# Altium schematic sheet 202_DC-DC.SchDoc: DC-DC
size A4; Date: XXXXXX; Author: R.Ducuara; DrawnBy: J.Jaramillo; Revision: R1V0; SheetNumber: 5; SheetTotal: 7
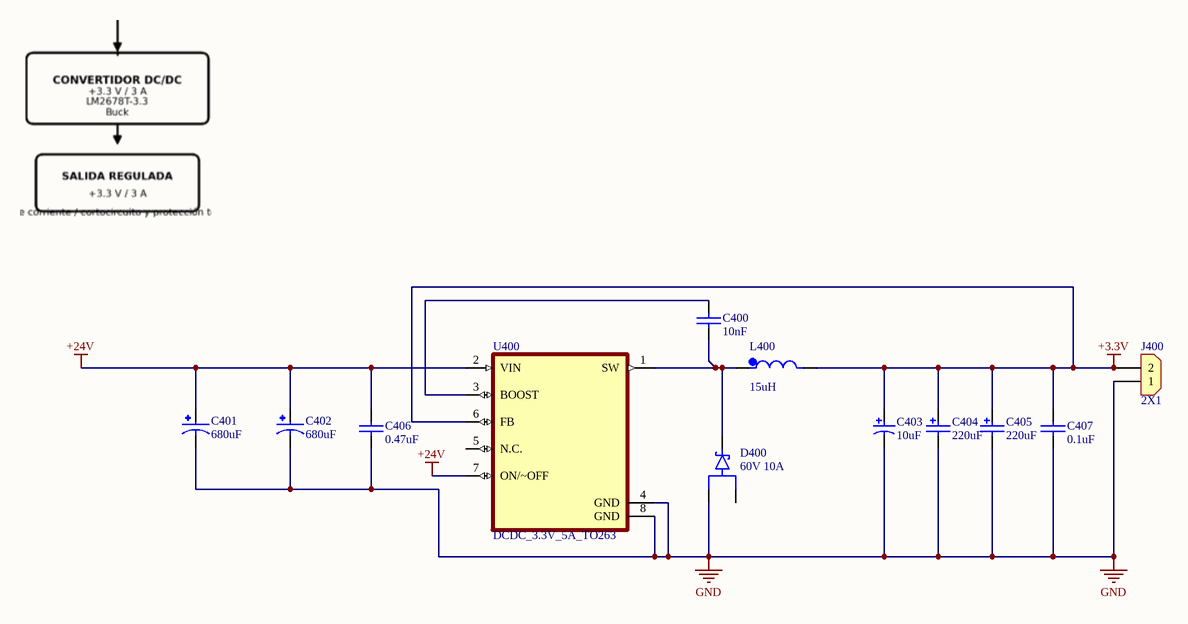
[diagram p0: 202_DC-DC.SchDoc]

## Parts
C400  value 10nF  [0603]  (hidden comment: 10nF 100V)
C401  value 680uF  [Cap_680uF_50V_ALUM_RAD]  (hidden comment: 680uF 50V)
C402  value 680uF  [Cap_680uF_50V_ALUM_RAD]  (hidden comment: 680uF 50V)
C403  value 10uF  [RADIAL-CAN-SMD_Diax4mm_Hx5.5mm]  (hidden comment: 10uF 10V)
C404  value 220uF  [RADIAL-CAN-SMD_Diax8mm_Hx10.2mm]  (hidden comment: 220uF 50V)
C405  value 220uF  [RADIAL-CAN-SMD_Diax8mm_Hx10.2mm]  (hidden comment: 220uF 50V)
C406  value 0.47uF  [0805]  (hidden comment: 0.47uF 50V)
C407  value 0.1uF  [0402_RF]  (hidden comment: 100nF 25V)
D400  60V 10A  [D_Schottky_30V_200mA_SOT23-3_1]
J400  2X1  [CON_2X1_TH_5MM_BAT]
L400  15uH  [L_15uH_7A_SMD]
U400  DCDC_3.3V_5A_TO263  [DCDC_3.3V_5A_TO263]

## Nets
+3.3V: C403.1 C404.1 C405.1 C407.1 J400.2 L400.2 U400.6(FB)
+24V: C401.P C402.P C406.1 U400.2(VIN) U400.7(ON/~OFF)
GND: C401.N C402.N C403.2 C404.2 C405.2 C406.2 C407.2 D400.1(A1) J400.1 U400.4(GND) U400.8(GND)
NetC400_1: C400.1 U400.3(BOOST)
NetC400_2: C400.2 D400.3(K) L400.1 U400.1(SW)

Not connected (* = marked no-connect by the designer): D400 2(A2); U400 5(N.C.)

## Notes on the sheet
- Title:
- Project:
- File:
- Revision:
- Date:
- Size:
- A4
- Drawn by:

## Library data of the parts
C400 = Cap_10000pF_0603_100V: CAP CER 10000PF 100V X7R 0603; Manufacturer: Walsin Technology Corporation; Manufacturer Part Number: 0603B103K101CT; Supplier 1: Digi-Key; Supplier Part Number 1: 1292-1383-1-ND; Last modified by: J.Jaramillo; Last modified date: 20240309; ComponentLink1Description: Digi-Key; ComponentLink1URL: https://www.digikey.com/en/products/detail/walsin-technology-corporation/0603B103K101CT/9354880?s=N4IgTCBcDaIIxgJxgLRwMwA51pQOQBEQBdAXyA
C401 C402 = Cap_680uF_50V_ALUM_RAD: Capacitores electrolíticos de aluminio 680 µF 50 V Radial, encapsulado 7000 h a 105°C; Manufacturer: Panasonic Industry; Manufacturer Part Number: EEU-FM1H681L; Last modified by: R,Ducuara; Last modified date: 20261120; Supplier 1: Avnet; Supplier Part Number 1: EEU-FM1H681L
C403 = Cap_10uF_10V_ALU_SMD: CAP ALUM 10UF 20% 10V SMD; Manufacturer: Würth Elektronik; Manufacturer Part Number: 865090240001; Supplier 1: Digi-Key; Supplier Part Number 1: 732-8394-1-ND; Last modified by: J.Jaramillo; Last modified date: 20240309; ComponentLink1Description: New link; ComponentLink1URL: https://www.digikey.com/en/products/detail/w%C3%BCrth-elektronik/865090240001/5727989?s=N4IgTCBcDaIOwGYwFoAcCCcAWZBGZAcgCIAEIAugL5A
C404 C405 = Cap_220uF_50V_ALU_SMD: CAP ALUM 220UF 20% 50V SMD; Manufacturer: Panasonic; Manufacturer Part Number: EEE-FT1H221AP; Supplier 1: Mouser; Supplier Part Number 1: 667-EEE-FT1H221AP; Reel stock: N/A; Last modified by: J.Jaramillo; Last modified date: 20240309; ComponentLink1Description: Mouser; ComponentLink1URL: https://www.mouser.com/ProductDetail/Panasonic/EEE-FT1H221AP?qs=CMJjuEs1%252BuFFGBuxQbDfDA==
C406 = Cap_0.47uF_0805_50V: CAP CER 0.47UF 50V X7R 0805; Manufacturer: KEMET; Manufacturer Part Number: C0805C474K5RACTU; Supplier 1: Digi-Key; Supplier Part Number 1: 399-8100-1-ND; Last modified by: J.Jaramillo; Last modified date: 20240309; ComponentLink1Description: Digi-Key; ComponentLink1URL: https://www.digikey.com/products/en?keywords=399-8100-1-ND
C407 = Cap_0.1uF_0402_25V: CAP CER 0.1UF 25V X7R 0402; Manufacturer: Yageo; Manufacturer Part Number: CC0402KRX7R8BB104; Last modified by: J.Jaramillo; Last modified date: 20240309; ComponentLink1Description: Digi-key; ComponentLink1URL: https://www.digikey.com/products/en?keywords=311-2077-1-ND; Supplier 1: Digi-Key; Supplier Part Number 1: 311-2077-1-ND
D400 = D_Schottky_60V_10A_ThinDPAK: DIODE SCHOTTKY 60V 10A THINDPAK; Manufacturer: Taiwan Semiconductor Corporation; Manufacturer Part Number: MBRAD1060H; Supplier 1: Digi-Key; Supplier Part Number 1: 1801-MBRAD1060HCT-ND; Reel Stock: N/A; Last modified by: R.Ducuara; Last modified date: 20261120; ComponentLink1Description: Digi-Key; ComponentLink1URL: https://www.digikey.com/en/products/detail/onsemi/SBAT54SLT1G/3062594
J400 = Con_2x1_TH_5mm_Battery: Power Connectors ROHS; Manufacturer: Changzhou Amass Elec; Manufacturer Part Number: XT30U-M; Supplier 1: LCSC; Supplier Part Number 1: C99101; Reel Stock: N/A; Last modified by: J.Jaramillo; Last modified date: 20240310; ComponentLink1Description: Digi-Key; ComponentLink1URL: https://lcsc.com/product-detail/Power-Connectors_Changzhou-Amass-Elec-XT30U-M_C99101.html
L400 = L_15uH_7A_SMD: 15 µH Blindado Núcleo de tambor, cableado Inductivo 7 A 50mOhm máx. No estándar; Manufacturer: Bourns Inc.; Manufacturer Part Number: SRP1040VA-150M; Supplier 1: Digi-key; Supplier Part Number 1: 118-SRP1040VA-150MCT-ND; Reel Stock: N/A; Last modified by: R.Ducuara; Last modified date: 21/11/2026
U400 = DCDC_3.3V_5A_TO263: IC REG BUCK 3.3V 5A TO263; Manufacturer: Texas Instruments; Manufacturer Part Number: LM2678S-3.3; Supplier 1: Digikey; Supplier Part Number 1: LM2678S-3.3-ND; Reel Stock: N/A; Last modified by: R.Ducuara; Last modified date: 20261120